# Altium schematic sheet power.SchDoc (part 2 of 2)
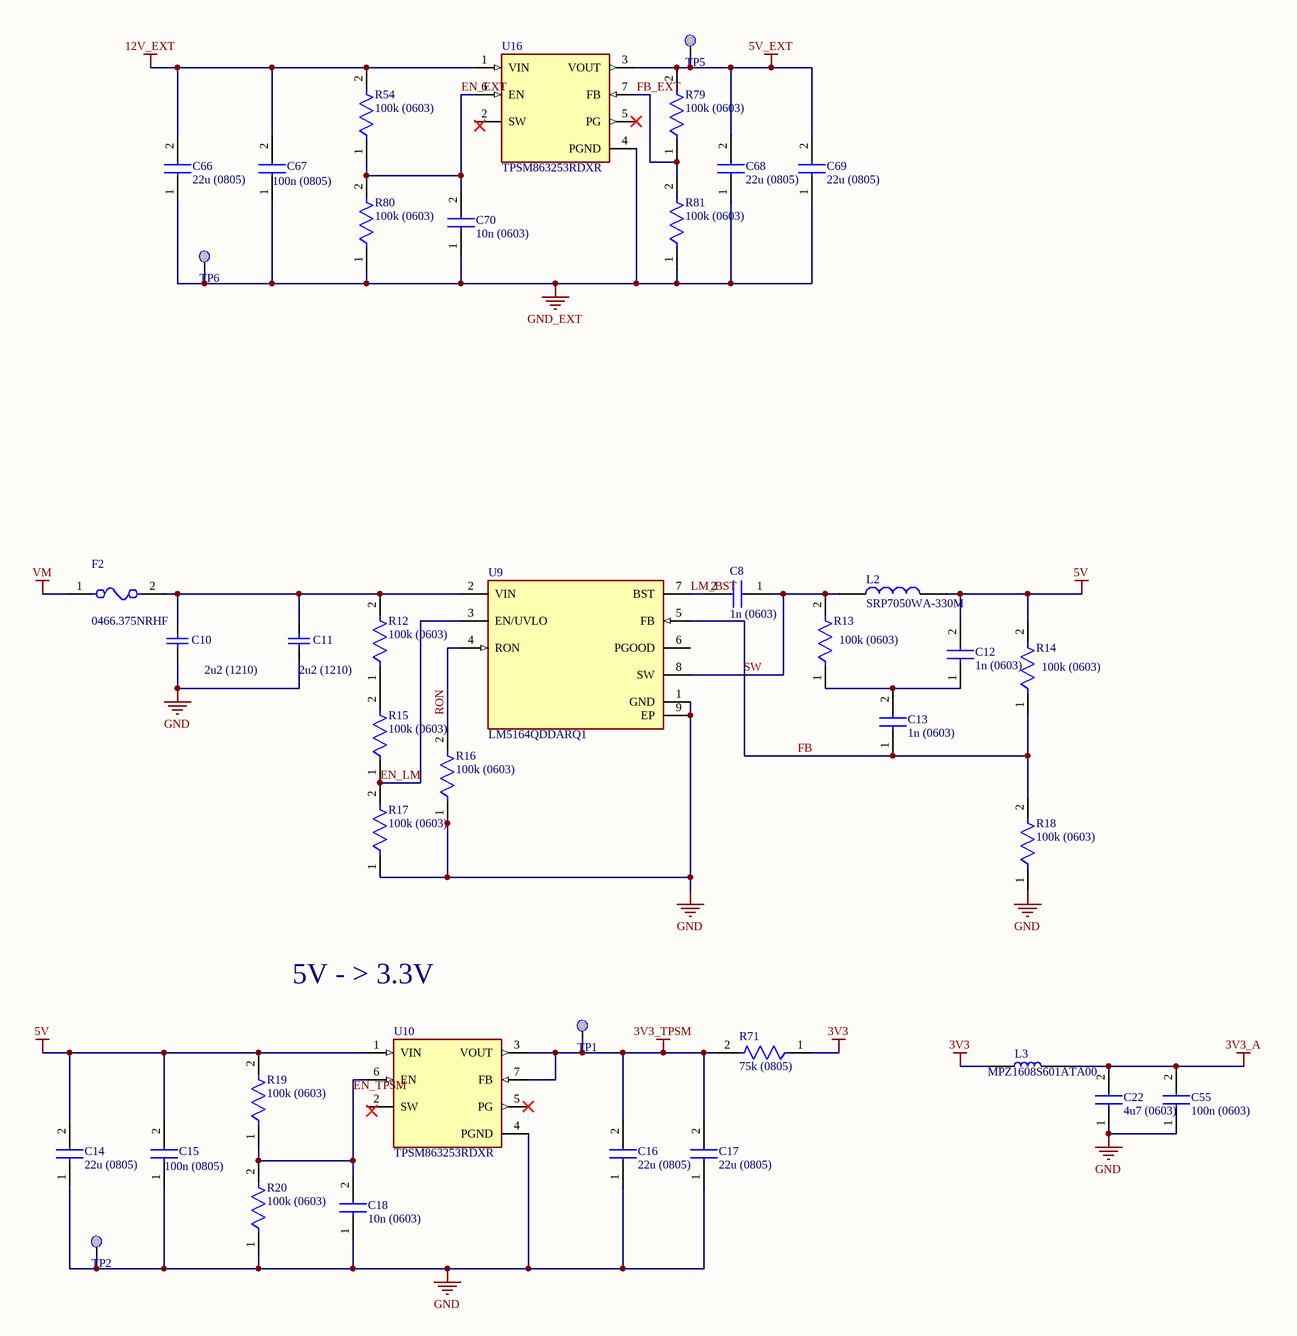
[diagram p1: power.SchDoc]

## Library data of the parts (continued)
R19 R20 R54 R79-R81 = SR0603FR-7T100KL: Res Thick Film 0603 100K Ohm 1% 0.25W(1/4W) ±100ppm/°C Pad SMD T/R Automotive AEC-Q200; Manufacturer_Name: Yageo Group; Manufacturer_Part_Number: SR0603FR-7T10KL; Power Rating: 250mW; Value: 10kΩ; Voltage Rating: 75V; Working Voltage: 150V; Datasheet Link: https://mouser.componentsearchengine.com/Datasheets/1/SR0603FR-7T10KL.pdf; Height: 0.55mm; Mouser Part Number: 603-SR0603FR-7T10KL; Mouser Price/Stock: https://www.mouser.co.uk/ProductDetail/YAGEO/SR0603FR-7T10KL?qs=pfd5qewlna6IurLw3u3uRA%3D%3D; Arrow Part Number: SR0603FR-7T10KL; Arrow Price/Stock: https://www.arrow.com/en/products/sr0603fr-7t10kl/yageo; Supplier: DigiKey; Supplier Part Number: YAG5823CT-ND; Manufacturer: Yageo Group; Manufacturer Part Number: SR0603FR-7T10KL; RoHS: Compliant; Category: Chip SMD Resistors; Pricing: 1=0,67, 10=0,399, 25=0,3376, 50=0,3022, 100=0,2744, 250=0,24612, 500=0,22976, 1000=0,21675 (USD); Case/Package: 0603; China RoHS: Non-Compliant; Composition: Thick Film; Country of Origin: Mainland China, Taiwan; Export Control Classification Number (ECCN) Code: EAR99; Harmonized Tariff Schedule (HTS) Code: 8533.21.00.30; Introduction Date: 2017-10-02; Length: 1.6mm; Lifecycle Status: Production; Max Operating Temperature: 155°C; Min Operating Temperature: -55°C; Mounting Technology: Surface Mount; Number of Terminals: 2; Packaging: Tape & Reel; Ratings: AEC-Q200; REACH SVHC: Yes; Temperature Coefficient: 100ppm/°C; Tolerance: 1%; Width: 800µm; ComponentLink1URL: https://datasheet.octopart.com:443/SR0603FR-7T10KL-Yageo-datasheet-176402240.pdf?src-supplier=Farnell; ComponentLink1Description: https://datasheet.octopart.com:443/SR0603FR-7T10KL-Yageo-datasheet-176402240.pdf?src-supplier=Farnell; ComponentLink2URL: https://datasheet.octopart.com:443/SR0603FR-7T10KL-Yageo-datasheet-119732217.pdf?src-supplier=Upverter; ComponentLink2Description: https://datasheet.octopart.com:443/SR0603FR-7T10KL-Yageo-datasheet-119732217.pdf?src-supplier=Upverter; ComponentLink3URL: https://datasheet.octopart.com:443/SR0603FR-7T10KL-Yageo-Group-datasheet-184785656.pdf?src-supplier=Future+Electronics; ComponentLink3Description: https://datasheet.octopart.com:443/SR0603FR-7T10KL-Yageo-Group-datasheet-184785656.pdf?src-supplier=Future+Electronics; ComponentLink4URL: https://datasheet.octopart.com:443/SR0603FR-7T10KL-Yageo-datasheet-155675517.pdf?src-supplier=Future+Electronics; ComponentLink4Description: https://datasheet.octopart.com:443/SR0603FR-7T10KL-Yageo-datasheet-155675517.pdf?src-supplier=Future+Electronics; ComponentLink5URL: https://datasheet.octopart.com:443/SR0603FR-7T10KL-Yageo-datasheet-137701088.pdf?src-supplier=Future+Electronics; ComponentLink5Description: https://datasheet.octopart.com:443/SR0603FR-7T10KL-Yageo-datasheet-137701088.pdf?src-supplier=Future+Electronics; ComponentLink6URL: https://datasheet.octopart.com/SR0603FR-7T10KL-Yageo-datasheet-11047080.pdf; ComponentLink6Description: https://datasheet.octopart.com/SR0603FR-7T10KL-Yageo-datasheet-11047080.pdf; ComponentLink7URL: http://sigma.octopart.com:80/conflict_mineral_statement/Yageo-company-3.pdf?src-supplier=Compliance+Statements; ComponentLink7Description: http://sigma.octopart.com:80/conflict_mineral_statement/Yageo-company-3.pdf?src-supplier=Compliance+Statements; ComponentLink8URL: http://sigma.octopart.com:80/rohs_statement/Yageo-company-2.pdf?src-supplier=Compliance+Statements; ComponentLink8Description: http://sigma.octopart.com:80/rohs_statement/Yageo-company-2.pdf?src-supplier=Compliance+Statements; Stock: 5000; ComponentLink9URL: https://datasheet.octopart.com:443/SR0603FR-7T4R7L-Yageo-datasheet-176402240.pdf?src-supplier=Farnell; ComponentLink9Description: https://datasheet.octopart.com:443/SR0603FR-7T4R7L-Yageo-datasheet-176402240.pdf?src-supplier=Farnell; ComponentLink10URL: https://datasheet.octopart.com:443/SR0603FR-7T4R7L-Yageo-datasheet-119732217.pdf?src-supplier=Upverter; ComponentLink10Description: https://datasheet.octopart.com:443/SR0603FR-7T4R7L-Yageo-datasheet-119732217.pdf?src-supplier=Upverter; ComponentLink11URL: https://datasheet.octopart.com:443/SR0603FR-7T4R7L-Yageo-Group-datasheet-184785656.pdf?src-supplier=Future+Electronics; ComponentLink11Description: https://datasheet.octopart.com:443/SR0603FR-7T4R7L-Yageo-Group-datasheet-184785656.pdf?src-supplier=Future+Electronics; ComponentLink12URL: https://datasheet.octopart.com:443/SR0603FR-7T4R7L-Yageo-datasheet-155675517.pdf?src-supplier=Future+Electronics; ComponentLink12Description: https://datasheet.octopart.com:443/SR0603FR-7T4R7L-Yageo-datasheet-155675517.pdf?src-supplier=Future+Electronics; ComponentLink13URL: https://datasheet.octopart.com:443/SR0603FR-7T4R7L-Yageo-datasheet-137701088.pdf?src-supplier=Future+Electronics; ComponentLink13Description: https://datasheet.octopart.com:443/SR0603FR-7T4R7L-Yageo-datasheet-137701088.pdf?src-supplier=Future+Electronics; ComponentLink14URL: https://datasheet.octopart.com/SR0603FR-7T4R7L-Yageo-datasheet-11047080.pdf; ComponentLink14Description: https://datasheet.octopart.com/SR0603FR-7T4R7L-Yageo-datasheet-11047080.pdf; Schedule B: 8533210045, 8533210045|8533210045|8533210045|8533210045|8533210045; ComponentLink15URL: https://datasheet.octopart.com:443/SR0603FR-7T100KL-Yageo-datasheet-176402240.pdf?src-supplier=element14+APAC; ComponentLink15Description: https://datasheet.octopart.com:443/SR0603FR-7T100KL-Yageo-datasheet-176402240.pdf?src-supplier=element14+APAC; ComponentLink16URL: https://datasheet.octopart.com:443/SR0603FR-7T100KL-Yageo-datasheet-119732217.pdf?src-supplier=Upverter; ComponentLink16Description: https://datasheet.octopart.com:443/SR0603FR-7T100KL-Yageo-datasheet-119732217.pdf?src-supplier=Upverter; ComponentLink17URL: https://datasheet.octopart.com:443/SR0603FR-7T100KL-Yageo-Group-datasheet-184785656.pdf?src-supplier=Future+Electronics; ComponentLink17Description: https://datasheet.octopart.com:443/SR0603FR-7T100KL-Yageo-Group-datasheet-184785656.pdf?src-supplier=Future+Electronics; ComponentLink18URL: https://datasheet.octopart.com:443/SR0603FR-7T100KL-Yageo-datasheet-155675517.pdf?src-supplier=Future+Electronics; ComponentLink18Description: https://datasheet.octopart.com:443/SR0603FR-7T100KL-Yageo-datasheet-155675517.pdf?src-supplier=Future+Electronics; ComponentLink19URL: https://datasheet.octopart.com:443/SR0603FR-7T100KL-Yageo-datasheet-137701088.pdf?src-supplier=Future+Electronics; ComponentLink19Description: https://datasheet.octopart.com:443/SR0603FR-7T100KL-Yageo-datasheet-137701088.pdf?src-supplier=Future+Electronics; ComponentLink20URL: https://datasheet.octopart.com/SR0603FR-7T100KL-Yageo-datasheet-11047080.pdf; ComponentLink20Description: https://datasheet.octopart.com/SR0603FR-7T100KL-Yageo-datasheet-11047080.pdf
R71 = RQ73C2A75KBTD: Fixed Resistor, Thin Film, 0.2W, 75000ohm, 100V, 0.1% +/-Tol, 10ppm/Cel, Surface Mount, 0805; Manufacturer Part Number: SR0805FR-7W4R7L; Manufacturer: Yageo; Manufacturer Lifecycle Status: ACTIVE; Automotive Grade: Grade 0; Resistance: 4.7Ω; Tolerance: 0.01; Voltage Rating: 150V; Value: 4.7Ω; Power Rating: 0.25W; Temperature Coefficient: 10ppm/°C; Temperature Range High: +155°C; Digikey Description: RES SMD 4.7 OHM 1% 1/4W 0805; RoHS: TRUE; Ipc Land Pattern Name: RESC200125X50; Category: Res; Automotive: Yes; Device Class L2: Resistors; ComponentLink2Description: Datasheet; Device Class L1: Passive Components; Temperature Range Low: -55°C; Lead Free: Yes; Footprint Url: http://www.yageo.com/exep/pages/download/literatures/PYu-R_Mount_10.pdf; Octopart: https://octopart.com/sr0805fr-7w4r7l-yageo-71414350; Height: 0.6mm; Composition: Thick Film; Device Class L3: Chip SMD Resistors; Series: SR; ComponentLink2URL: http://www.yageo.com/documents/recent/PYu-SR_D_F%20tol_RoHS_L_3.pdf; Package: SR0805; Temperature: -55°C to +155°C; Supplier: Farnell; Supplier Part Number: RQ73C2A75KBTD; Stock: 3515; Case/Package: 0805; China RoHS: Compliant; Length: 2mm; Lifecycle Status: Production; Max Operating Temperature: 155°C; Min Operating Temperature: -55°C; Mounting Technology: Surface Mount; Number of Terminals: 2; Operating Supply Voltage: 100V; Ratings: AEC-Q200; REACH SVHC: Yes; Width: 1.25mm; Working Voltage: 100V; ComponentLink1URL: https://datasheet.octopart.com:443/RQ73C2A75KBTD-TE-Connectivity-datasheet-179163842.pdf?src-supplier=IHS; ComponentLink1Description: https://datasheet.octopart.com:443/RQ73C2A75KBTD-TE-Connectivity-datasheet-179163842.pdf?src-supplier=IHS; ComponentLink3URL: https://datasheet.octopart.com:443/RQ73C2A75KBTD-TE-Connectivity-datasheet-141404639.pdf?src-supplier=Upverter; ComponentLink3Description: https://datasheet.octopart.com:443/RQ73C2A75KBTD-TE-Connectivity-datasheet-141404639.pdf?src-supplier=Upverter; ComponentLink4URL: https://datasheet.octopart.com:443/RQ73C2A75KBTD-TE-Connectivity-datasheet-129104565.pdf?src-supplier=Electro+Sonic; ComponentLink4Description: https://datasheet.octopart.com:443/RQ73C2A75KBTD-TE-Connectivity-datasheet-129104565.pdf?src-supplier=Electro+Sonic; ComponentLink5URL: https://sigma.octopart.com:443/129121914/technical_drawing/TE-Connectivity-RQ73C2A75KBTD.pdf?src-supplier=TE+Connectivity; ComponentLink5Description: https://sigma.octopart.com:443/129121914/technical_drawing/TE-Connectivity-RQ73C2A75KBTD.pdf?src-supplier=TE+Connectivity; ComponentLink6URL: https://datasheet.octopart.com:443/7-2176381-6-TE-Connectivity-datasheet-181572785.pdf?src-supplier=Sager+Electronics; ComponentLink6Description: https://datasheet.octopart.com:443/7-2176381-6-TE-Connectivity-datasheet-181572785.pdf?src-supplier=Sager+Electronics
TP1 TP2 TP5 TP6 = TestPoint: Standard test point 1mm
U9 = CMP-04918-000331-1: POWER MANAGEMENT; RoHS Compliant: Yes
U10 U16 = TPSM863253RDXR: 3V to 17V input voltage, 3.3V, 3A output synchronous buck module in QFN package 7-QFN-FCMOD -40 to 125; Manufacturer Lifecycle Status: ACTIVE; MF: Texas Instruments; SnapEDA_Link: https://www.snapeda.com/parts/TPSM863253RDXR/Texas+Instruments/view-part/?ref=snap; Package: None; Value: *; MP: TPSM863253RDXR; Check_prices: https://www.snapeda.com/parts/TPSM863253RDXR/Texas+Instruments/view-part/?ref=eda; Supplier: DigiKey; Supplier Part Number: 296-TPSM863253RDXRCT-ND; Manufacturer: Texas Instruments; Manufacturer Part Number: TPSM863253RDXR; RoHS: Compliant; Category: Integrated Circuits (ICs); Stock: 3257; Pricing: 1=2,63, 10=1,96, 25=1,7924, 100=1,6078, 250=1,51976, 500=1,46668, 1000=1,42301 (USD); Height: 0m; Length: 4mm; Lifecycle Status: Production; Pins: 7; Thickness: 2mm; Width: 3.3mm; ComponentLink1URL: https://octopart.com:443/opatz8j6/c1?t=jS2VDNp59x-r3M4UnJwIkxDyXkbjHNSAoP2Fns5-Wk80kLlb-mQ5gVuk8zyi84j77RuBrZF-262aE3noOfDKcDGPEWkV9DoDQewFCLFFRyInceCxvVyAfhTYCYIywjkPWDqBy3YcbHQILjtWA_Eaj3WAHosXV5eHD7vpZYJjVrSO88bXdsuSYdlpSx9vUfFmQgFuFA-HMfKLGSBXL49TLOzJ5T2tngLQpQw-KF5iF-olhgVCegbBT0_kXe8-zNmOJ90ZL3AMoFtxFgWXTiA3kg8TbPVDzmO9NJcakYYdjuReFGLrhU-Lh8uurvImosMTR0LFVg6PaXdiPOKNUC1j5THOrz5of0wHKRbirvbX2rJGgWFTmZxbk0I20_VZT7Zu5rI_wToFdFWt&src-supplier=Texas+Instruments; ComponentLink1Description: https://octopart.com:443/opatz8j6/c1?t=jS2VDNp59x-r3M4UnJwIkxDyXkbjHNSAoP2Fns5-Wk80kLlb-mQ5gVuk8zyi84j77RuBrZF-262aE3noOfDKcDGPEWkV9DoDQewFCLFFRyInceCxvVyAfhTYCYIywjkPWDqBy3YcbHQILjtWA_Eaj3WAHosXV5eHD7vpZYJjVrSO88bXdsuSYdlpSx9vUfFmQgFuFA-HMfKLGSBXL49TLOzJ5T2tngLQpQw-KF5iF-olhgVCegbBT0_kXe8-zNmOJ90ZL3AMoFtxFgWXTiA3kg8TbPVDzmO9NJcakYYdjuReFGLrhU-Lh8uurvImosMTR0LFVg6PaXdiPOKNUC1j5THOrz5of0wHKRbirvbX2rJGgWFTmZxbk0I20_VZT7Zu5rI_wToFdFWt&src-supplier=Texas+Instruments; ComponentLink2URL: https://datasheet.octopart.com:443/TPSM863253RDXR-Texas-Instruments-datasheet-184174687.pdf?src-supplier=LCSC; ComponentLink2Description: https://datasheet.octopart.com:443/TPSM863253RDXR-Texas-Instruments-datasheet-184174687.pdf?src-supplier=LCSC; ComponentLink3URL: http://sigma.octopart.com:80/reach_statement/Texas-Instruments-company-64.pdf?src-supplier=Compliance+Statements; ComponentLink3Description: http://sigma.octopart.com:80/reach_statement/Texas-Instruments-company-64.pdf?src-supplier=Compliance+Statements; ComponentLink4URL: http://sigma.octopart.com:80/conflict_mineral_statement/Texas-Instruments-company-63.pdf?src-supplier=Compliance+Statements; ComponentLink4Description: http://sigma.octopart.com:80/conflict_mineral_statement/Texas-Instruments-company-63.pdf?src-supplier=Compliance+Statements